# Altium schematic sheet Connectors.SchDoc
size 406 x 304 mm; SheetNumber: 4; SheetTotal: 8
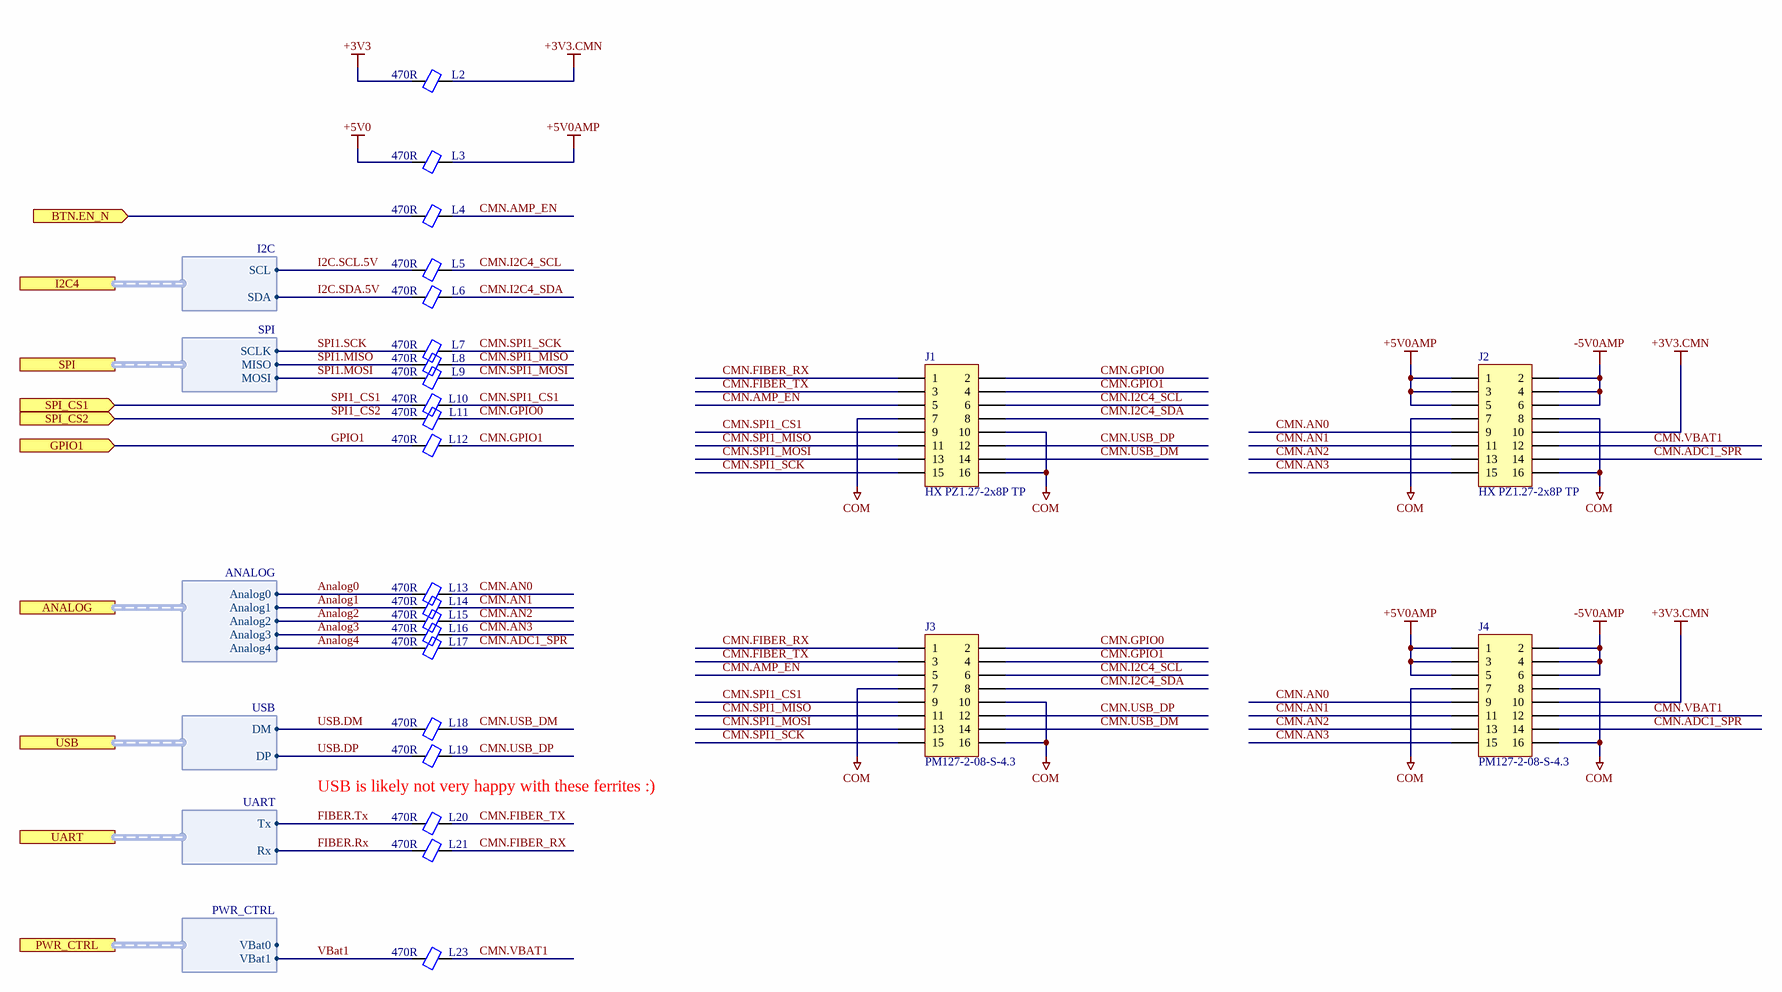
[diagram p0: Connectors.SchDoc]

## Parts
J1  HX PZ1.27-2x8P TP  [HANXIA_HX PZ1.27-2x8P TP]
J2  HX PZ1.27-2x8P TP  [HANXIA_HX PZ1.27-2x8P TP]
J3  PM127-2-08-S-4.3  [HCTL_PM127-2-08-S-4.3]
J4  PM127-2-08-S-4.3  [HCTL_PM127-2-08-S-4.3]
L2  470R  [INDC1005X05N]
L3  470R  [INDC1005X05N]
L4  470R  [INDC1005X05N]
L5  470R  [INDC1005X05N]
L6  470R  [INDC1005X05N]
L7  470R  [INDC1005X05N]
L8  470R  [INDC1005X05N]
L9  470R  [INDC1005X05N]
L10  470R  [INDC1005X05N]
L11  470R  [INDC1005X05N]
L12  470R  [INDC1005X05N]
L13  470R  [INDC1005X05N]
L14  470R  [INDC1005X05N]
L15  470R  [INDC1005X05N]
L16  470R  [INDC1005X05N]
L17  470R  [INDC1005X05N]
L18  470R  [INDC1005X05N]
L19  470R  [INDC1005X05N]
L20  470R  [INDC1005X05N]
L21  470R  [INDC1005X05N]
L23  470R  [INDC1005X05N]

## Ports
ANALOG (harness ANALOG), BTN.EN_N (in), GPIO1 (in), I2C4 (harness I2C), PWR_CTRL (harness PWR_CTRL), SPI (harness SPI), SPI_CS1 (in), SPI_CS2 (in), UART (harness UART), USB (harness USB)

## Harnesses
I2C: SCL, SDA
SPI: SCLK, MISO, MOSI
ANALOG: Analog0, Analog1, Analog2, Analog3, Analog4
USB: DM, DP
UART: Tx, Rx
PWR_CTRL: VBat0, VBat1

## Nets
+3V3: L2.1
+3V3.CMN: J2.10 J4.10 L2.2
+5V0: L3.1
+5V0AMP: J2.1 J2.3 J2.5 J4.1 J4.3 J4.5 L3.2
-5V0AMP: J2.2 J2.4 J2.6 J4.2 J4.4 J4.6
COM: J1.7 J1.10 J1.16 J2.7 J2.8 J2.16 J3.7 J3.10 J3.16 J4.7 J4.8 J4.16
Analog0: L13.1 ; port ANALOG.Analog0
Analog1: L14.1 ; port ANALOG.Analog1
Analog2: L15.1 ; port ANALOG.Analog2
Analog3: L16.1 ; port ANALOG.Analog3
Analog4: L17.1 ; port ANALOG.Analog4
BTN.EN_N: L4.1 ; port BTN.EN_N
CMN.ADC1_SPR: J2.14 J4.14 L17.2
CMN.AMP_EN: J1.5 J3.5 L4.2
CMN.AN0: J2.9 J4.9 L13.2
CMN.AN1: J2.11 J4.11 L14.2
CMN.AN2: J2.13 J4.13 L15.2
CMN.AN3: J2.15 J4.15 L16.2
CMN.FIBER_RX: J1.1 J3.1 L21.2
CMN.FIBER_TX: J1.3 J3.3 L20.2
CMN.GPIO0: J1.2 J3.2 L11.2
CMN.GPIO1: J1.4 J3.4 L12.2
CMN.I2C4_SCL: J1.6 J3.6 L5.2
CMN.I2C4_SDA: J1.8 J3.8 L6.2
CMN.SPI1_CS1: J1.9 J3.9 L10.2
CMN.SPI1_MISO: J1.11 J3.11 L8.2
CMN.SPI1_MOSI: J1.13 J3.13 L9.2
CMN.SPI1_SCK: J1.15 J3.15 L7.2
CMN.USB_DM: J1.14 J3.14 L18.2
CMN.USB_DP: J1.12 J3.12 L19.2
CMN.VBAT1: J2.12 J4.12 L23.2
FIBER.Rx: L21.1 ; port UART.Rx
FIBER.Tx: L20.1 ; port UART.Tx
GPIO1: L12.1 ; port GPIO1
I2C.SCL.5V: L5.1 ; port I2C4.SCL
I2C.SDA.5V: L6.1 ; port I2C4.SDA
SPI1.MISO: L8.1 ; port SPI.MISO
SPI1.MOSI: L9.1 ; port SPI.MOSI
SPI1.SCK: L7.1 ; port SPI.SCLK
SPI1_CS1: L10.1 ; port SPI_CS1
SPI1_CS2: L11.1 ; port SPI_CS2
USB.DM: L18.1 ; port USB.DM
USB.DP: L19.1 ; port USB.DP
VBat1: L23.1 ; port PWR_CTRL.VBat1

## Notes on the sheet
- USB is likely not very happy with these ferrites :)
- Sheet Name:
- Date:
- Sheet
- Designer:
- of

## Library data of the parts
J1 J2 = CONN,Hdr,2x8 Pin,1.27mm,SMD: CONN HEADER 16POS 1.27mm DUAL ROW SMD; Manufacturer 1: hanxia; Vendor 1 Part Number: C41376040; Vendor 1: LCSC; Part Name: CONN,Hdr,2x8 Pin,1.27mm,SMD; CreatedBy: Judd Foster; HelpURL: https://www.lcsc.com/datasheet/C41376040.pdf?spm=wm.sxq.inf.ggs___wm.fly.bg.0.xh&lcsc_vid=T1ELXwUHQlNYVlZRE1JdXlRQFVgNBF1eTlFXBVxWRAAxVlNeQ1lYVlFUQlNXXjsOAxUeFF5JWBYZEEoKFBINSQcJGk4eFQsCAgIaSgADAwAHC0slRFhZUlVVQ08GEwkK; Manufacturer 1 Part Number: HX PZ1.27-2x8P TP
J3 J4 = CONN,Rcpt,2x8 Pin,1.27mm,SMD: CONN SOCKET 16POS 1.27mm DUAL ROW SMD; Manufacturer 1: HCTL; Vendor 1 Part Number: C3975134; Vendor 1: LCSC; Part Name: CONN,Rcpt,2x8 Pin,1.27mm,SMD; CreatedBy: Judd Foster; HelpURL: https://www.lcsc.com/datasheet/C3975134.pdf?spm=wm.sxq.inf.ggs___wm.fly.bg.0.xh&lcsc_vid=T1ELXwUHQlNYVlZRE1JdXlRQFVgNBF1eTlFXBVxWRAAxVlNeQ1lYVldfR1VbXjsOAxUeFF5JWBYZEEoKFBINSQcJGk4dAgUUFAk%3D; Manufacturer 1 Part Number: PM127-2-08-S-4.3
L2-L21 L23 = Ferrite,470R@100MHz,0402: 470 Ohms @ 100 MHz 1 Power Line Ferrite Bead 0402 (1005 Metric) 1A 200mOhm; Manufacturer 1: Murata Electronics; Manufacturer 1 Part Number: BLM15PX471SN1D; Vendor 1 Part Number: 490-10662-1-ND; Vendor 1: Digikey; Part Name: Ferrite,470R@100MHz,0402; CreatedBy: Judd Foster; HelpURL: https://www.murata.com/en-us/products/productdata/8796740059166/ENFA0018.pdf; Value: 470R